# Altium schematic sheet power_module.SchDoc
size A2; CheckedBy: Ковальов С.; Author: Ковальов Ю.; SheetNumber: 2; SheetTotal: 5; ApprovedBy: _; CompanyName: ЦНТУ; Organization: Altium Limited; Address1: L3, 12a Rodborough Rd; Address2: Frenchs Forest; Address3: NSW; Address4: Australia 2086; PageSetup: Record=PageOptions|CenterHorizontal=True|CenterVertical=True|PrintScale=0.94|XCorrection=1.00|YCorrection=1.00|PrintKind=1|BorderSize=5000000|LeftOffset=0|BottomOffset=0|Orientation=1|PaperLength=1000|PaperWidth=1000|Scale=100|PaperSource=7|PrintQuality=-4|MediaType=1|DitherType=10|PaperKind=A4|PrintScaleMode=1; DecimalNumber: .001; HeadOfSector: Нач. сектора; Name: POWER MODULE; NameShort: вуп-5м; Litera: A; SCH_VERSION: Версия 0
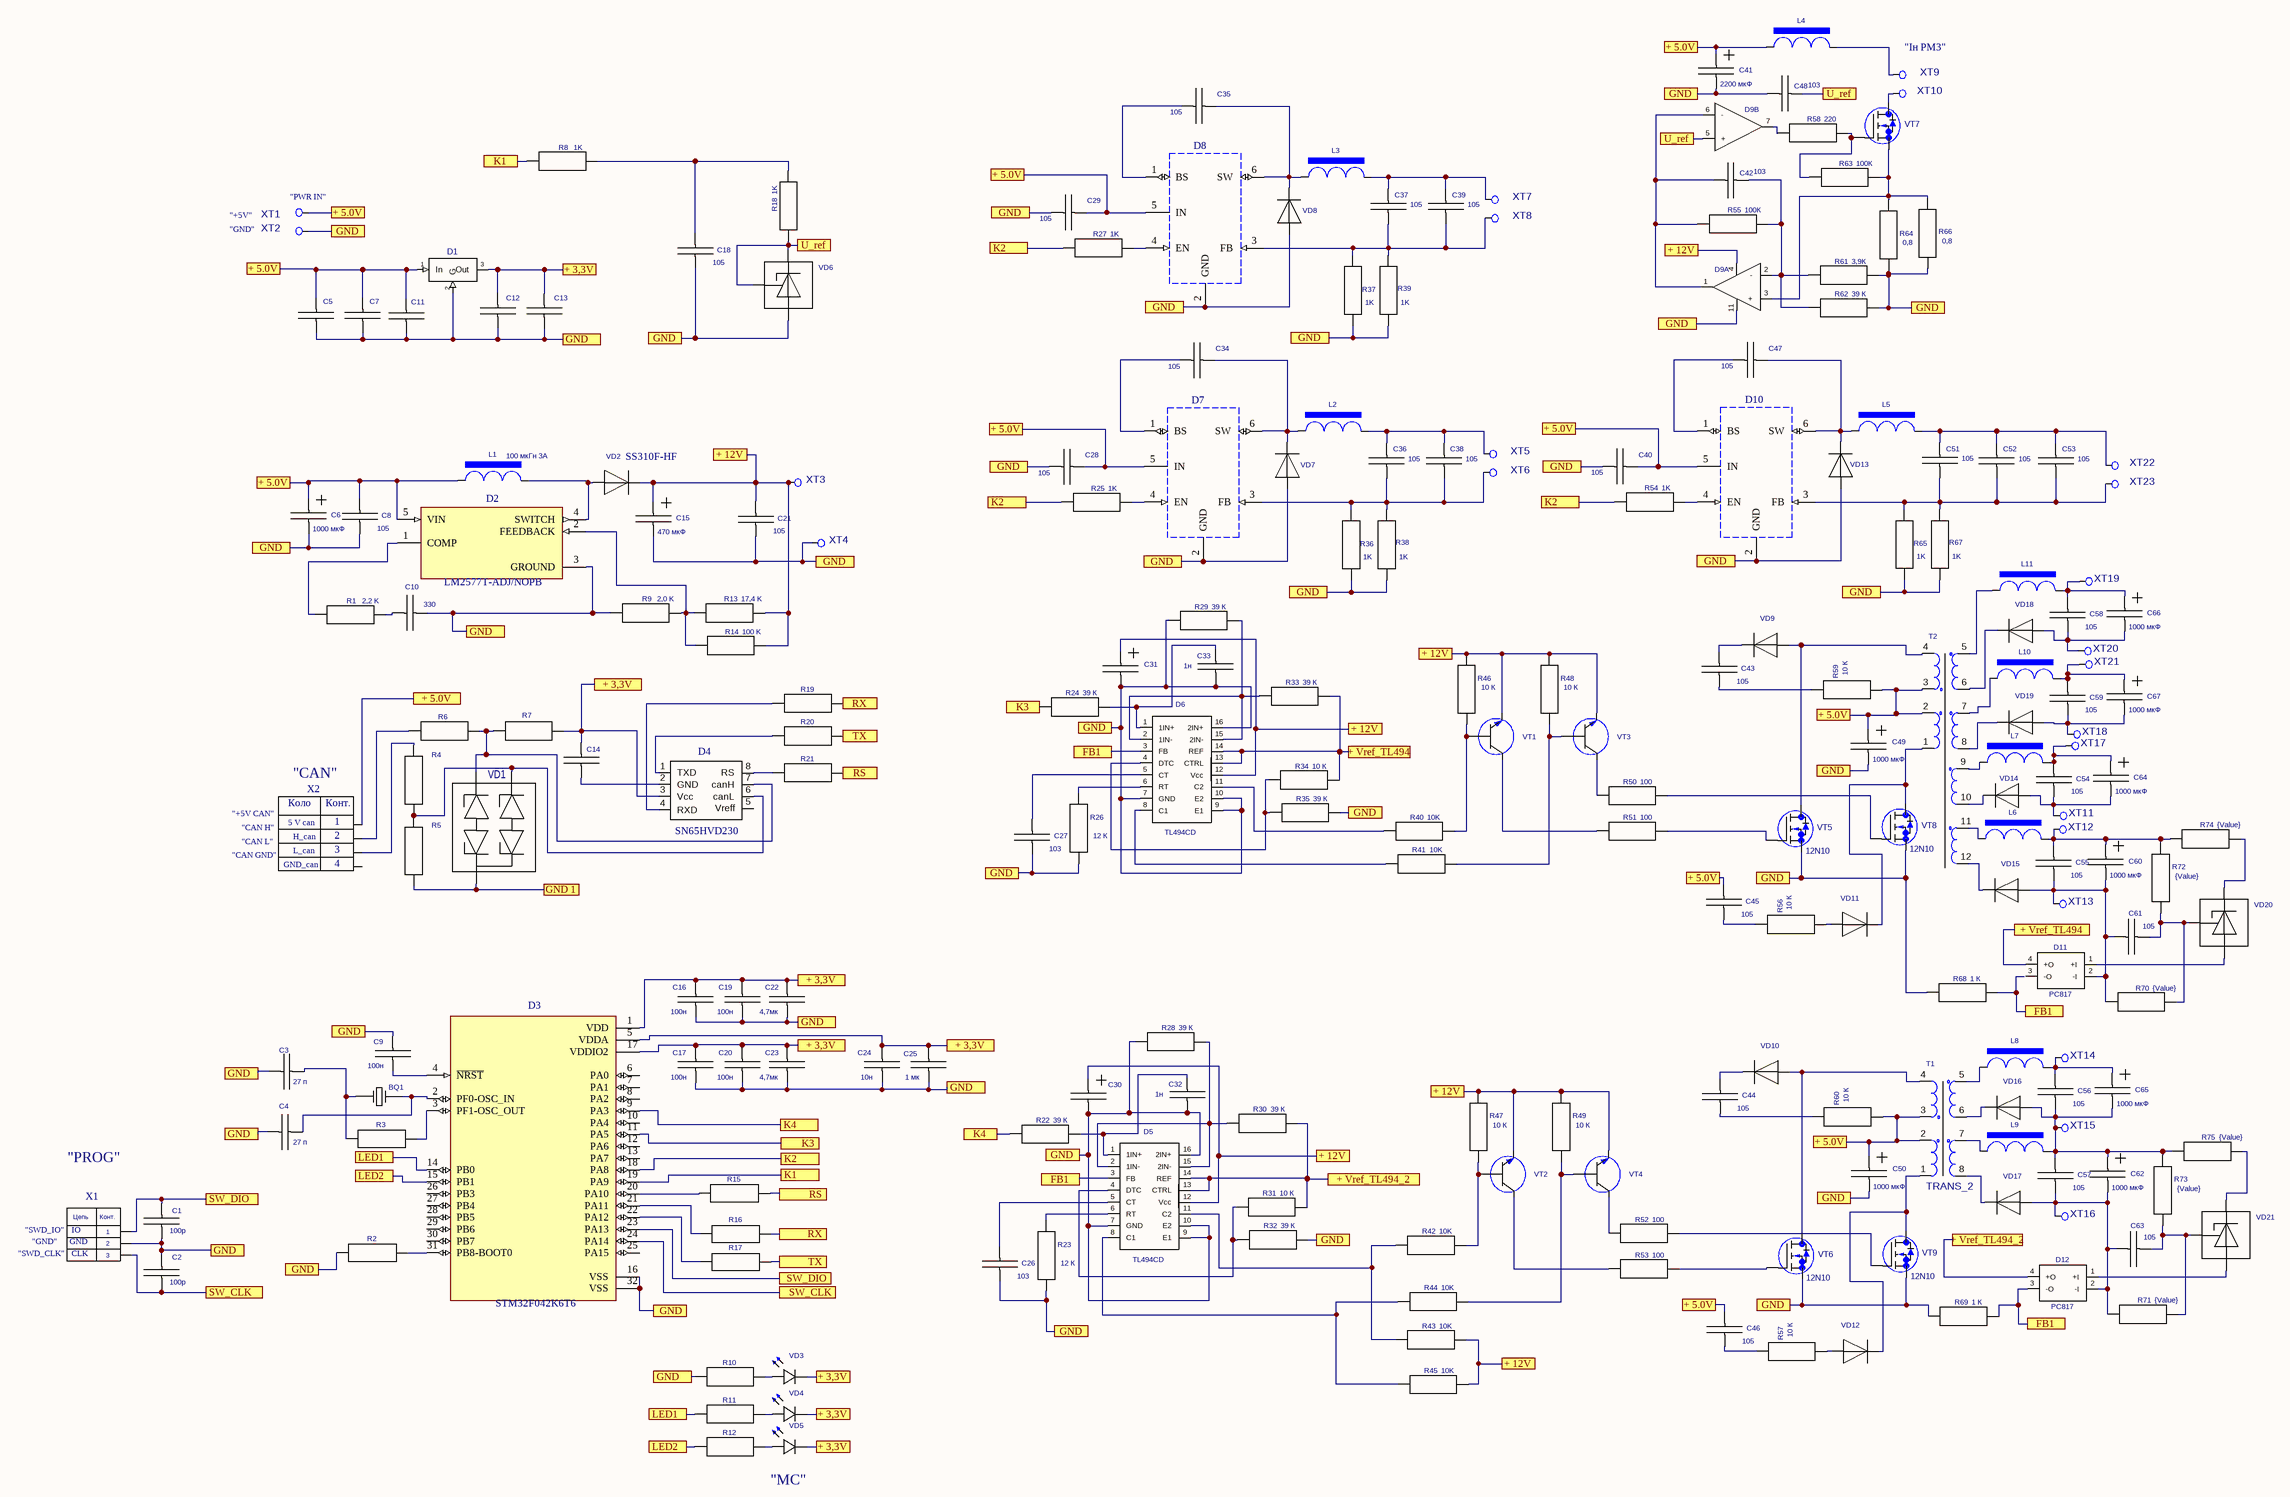
[diagram p0: power_module.SchDoc]

## Parts
BQ1  HC-49S  [HC-49S]  (value not drawn)
C1  100 p: 100p  [CAP-0805]  (hidden comment: CC0805)
C2  value 100p  [CAP-0805]  (hidden comment: CC0805)
C3  value 27 п  [CAP-0805]  (hidden comment: CC0805)
C4  value 27 п  [CAP-0805]  (hidden comment: CC0805)
C5  CAPH  [CAP-0805]  (value not drawn)
C6  value 1000 мкФ  [CAP-D8C3.5H12]  (hidden comment: C-RAD-3,5X8)
C7  CAPH  [CAP-0805]  (value not drawn)
C8  value 105  [CAP-0805]  (hidden comment: CC0805)
C9  value 100н  [CAP-0805]  (hidden comment: CC0805)
C10  value 330  [CAP-0805]  (hidden comment: CC0805)
C11  CAPH  [CAP-0805]  (value not drawn)
C12  CAPH  [CAP-0805]  (value not drawn)
C13  CAPH  [CAP-0805]  (value not drawn)
C14  CC0805  [CAP-0805]  (value not drawn)
C15  value 470 мкФ  [CAP-D8C3.5H12]  (hidden comment: C-RAD-3,5X8)
C16  value 100н  [CAP-0805]  (hidden comment: CC0805)
C17  value 100н  [CAP-0805]  (hidden comment: CC0805)
C18  value 105  [CAP-0805]  (hidden comment: CC0805)
C19  value 100н  [CAP-0805]  (hidden comment: CC0805)
C20  value 100н  [CAP-0805]  (hidden comment: CC0805)
C21  value 105  [CAP-0805]  (hidden comment: CC0805)
C22  value 4,7мк  [CAP-0805]  (hidden comment: CC0805)
C23  value 4,7мк  [CAP-0805]  (hidden comment: CC0805)
C24  value 10н  [CAP-0805]  (hidden comment: CC0805)
C25  value 1 мк  [CAP-0805]  (hidden comment: CC0805)
C26  value 103  [CAP-0805]  (hidden comment: CC0805)
C27  value 103  [CAP-0805]  (hidden comment: CC0805)
C28  value 105  [CAP-1206]  (hidden comment: CC0805)
C29  value 105  [CAP-1206]  (hidden comment: CC0805)
C30  C-RAD-3,5X8  [CAP-1206]  (value not drawn)
C31  C-RAD-3,5X8  [CAP-1206]  (value not drawn)
C32  value 1н  [CAP-0805]  (hidden comment: CC0805)
C33  value 1н  [CAP-0805]  (hidden comment: CC0805)
C34  value 105  [CAP-1206]  (hidden comment: CC0805)
C35  value 105  [CAP-1206]  (hidden comment: CC0805)
C36  value 105  [CAP-1206]  (hidden comment: CC0805)
C37  value 105  [CAP-1206]  (hidden comment: CC0805)
C38  value 105  [CAP-1206]  (hidden comment: CC0805)
C39  value 105  [CAP-1206]  (hidden comment: CC0805)
C40  value 105  [CAP-1206]  (hidden comment: CC0805)
C41  value 2200 мкФ  [CAP-D8C3.5H12]  (hidden comment: C-RAD-3,5X8)
C42  value 103  [CAP-0805]  (hidden comment: CC0805)
C43  value 105  [CAP-1206]  (hidden comment: CC0805)
C44  value 105  [CAP-1206]  (hidden comment: CC0805)
C45  value 105  [CAP-1206]  (hidden comment: CC0805)
C46  value 105  [CAP-1206]  (hidden comment: CC0805)
C47  value 105  [CAP-1206]  (hidden comment: CC0805)
C48  value 103  [CAP-0805]  (hidden comment: CC0805)
C49  value 1000 мкФ  [CAP-D8C3.5H12]  (hidden comment: C-RAD-3,5X8)
C50  value 1000 мкФ  [CAP-D8C3.5H12]  (hidden comment: C-RAD-3,5X8)
C51  value 105  [CAP-1206]  (hidden comment: CC0805)
C52  value 105  [CAP-1206]  (hidden comment: CC0805)
C53  value 105  [CAP-1206]  (hidden comment: CC0805)
C54  value 105  [CAP-0805]  (hidden comment: CC0805)
C55  value 105  [CAP-0805]  (hidden comment: CC0805)
C56  value 105  [CAP-1808(4_5x2_0mm)]  (hidden comment: CC0805)
C57  value 105  [CAP-1808(4_5x2_0mm)]  (hidden comment: CC0805)
C58  value 105  [CAP-0805]  (hidden comment: CC0805)
C59  value 105  [CAP-0805]  (hidden comment: CC0805)
C60  value 1000 мкФ  [CAP-D8C3.5H12]  (hidden comment: C-RAD-3,5X8)
C61  value 105  [CAP-0805]  (hidden comment: CC0805)
C62  value 1000 мкФ  [CAP-D10C5H20]  (hidden comment: C-RAD-3,5X8)
C63  value 105  [CAP-0805]  (hidden comment: CC0805)
C64  value 1000 мкФ  [CAP-D8C3.5H12]  (hidden comment: C-RAD-3,5X8)
C65  value 1000 мкФ  [CAP-D10C5H20]  (hidden comment: C-RAD-3,5X8)
C66  value 1000 мкФ  [CAP-D8C3.5H12]  (hidden comment: C-RAD-3,5X8)
C67  value 1000 мкФ  [CAP-D8C3.5H12]  (hidden comment: C-RAD-3,5X8)
D1  LM78M05  [DPAK(IR)]  (value not drawn)
D2  LM2577T-ADJ/NOPB  [VREG_LM2577T-ADJ/NOPB]
D3  STM32F042K6T6  [QFP80P900X900X160-32N]
D4  SN65HVD230  [8-SOIC]
D5  TL494CD  [SOIC16MY]
D6  TL494CD  [SOIC16MY]
D7  AP3211  [SOT23-6A]  (value not drawn)
D8  AP3211  [SOT23-6A]  (value not drawn)
D9  MC34074D_VCC  [14-SOIC]  (value not drawn)  (parts A,B of 4)
D10  AP3211  [SOT23-6A]  (value not drawn)
D11  PC817  [PC123PJ]
D12  PC817  [PC123PJ]
L1  value 100 мкГн 3A  [L_HCJRH01207]  (hidden comment: RLH)
L2  RLH  [L_HCJRH0704]  (value not drawn)
L3  RLH  [L_HCJRH0704]  (value not drawn)
L4  RLH  [L_HCJRH01207]  (value not drawn)
L5  RLH  [L_HCJRH0704]  (value not drawn)
L6  RLH  [L_HCJRH01207]  (value not drawn)
L7  RLH  [L_HCJRH01207]  (value not drawn)
L8  RLH  [L_HCJRH0704]  (value not drawn)
L9  RLH  [L_HCJRH0704]  (value not drawn)
L10  RLH  [L_HCJRH01207]  (value not drawn)
L11  RLH  [L_HCJRH01207]  (value not drawn)
R1  value 2,2 K  [RES-0805]  (hidden comment: RC0805)
R2  Resoistor 0805  [RES-0805]  (value not drawn)
R3  Resoistor 0805  [RES-0805]  (value not drawn)
R4  Resistor 1206  [RES-1206]  (value not drawn)
R5  Resistor 1206  [RES-1206]  (value not drawn)
R6  Resistor 1206  [RES-1206]  (value not drawn)
R7  Resistor 1206  [RES-1206]  (value not drawn)
R8  value 1K  [RES-0805]  (hidden comment: RC0805)
R9  value 2,0 K  [RES-0805]  (hidden comment: RC0805)
R10  Resoistor 0805  [RES-0805]  (value not drawn)
R11  Resoistor 0805  [RES-0805]  (value not drawn)
R12  Resoistor 0805  [RES-0805]  (value not drawn)
R13  value 17,4 K  [RES-0805]  (hidden comment: RC0805)
R14  value 100 K  [RES-0805]  (hidden comment: RC0805)
R15  Resoistor 0805  [RES-0805]  (value not drawn)
R16  Resoistor 0805  [RES-0805]  (value not drawn)
R17  Resoistor 0805  [RES-0805]  (value not drawn)
R18  value 1K  [RES-0805]  (hidden comment: RC0805)
R19  Resoistor 0805  [RES-0805]  (value not drawn)
R20  Resoistor 0805  [RES-0805]  (value not drawn)
R21  Resoistor 0805  [RES-0805]  (value not drawn)
R22  value 39 К  [RES-1206]  (hidden comment: RC0805)
R23  value 12 К  [RES-0805]  (hidden comment: RC0805)
R24  value 39 К  [RES-0805]  (hidden comment: RC0805)
R25  value 1K  [RES-0805]  (hidden comment: RC0805)
R26  value 12 К  [RES-0805]  (hidden comment: RC0805)
R27  value 1K  [RES-0805]  (hidden comment: RC0805)
R28  value 39 К  [RES-0805]  (hidden comment: RC0805)
R29  value 39 К  [RES-0805]  (hidden comment: RC0805)
R30  value 39 К  [RES-0805]  (hidden comment: RC0805)
R31  value 10 К  [RES-0805]  (hidden comment: RC0805)
R32  value 39 К  [RES-0805]  (hidden comment: RC0805)
R33  value 39 К  [RES-0805]  (hidden comment: RC0805)
R34  value 10 К  [RES-0805]  (hidden comment: RC0805)
R35  value 39 К  [RES-0805]  (hidden comment: RC0805)
R36  value 1K  [RES-2512]  (hidden comment: RC0805)
R37  value 1K  [RES-2512]  (hidden comment: RC0805)
R38  value 1K  [RES-2512]  (hidden comment: RC0805)
R39  value 1K  [RES-2512]  (hidden comment: RC0805)
R40  value 10K  [RES-0805]  (hidden comment: RC0805)
R41  value 10K  [RES-0805]  (hidden comment: RC0805)
R42  value 10K  [RES-0805]  (hidden comment: RC0805)
R43  value 10K  [RES-0805]  (hidden comment: RC0805)
R44  value 10K  [RES-0805]  (hidden comment: RC0805)
R45  value 10K  [RES-0805]  (hidden comment: RC0805)
R46  value 10 К  [RES-0805]  (hidden comment: RC0805)
R47  value 10 К  [RES-0805]  (hidden comment: RC0805)
R48  value 10 К  [RES-0805]  (hidden comment: RC0805)
R49  value 10 К  [RES-0805]  (hidden comment: RC0805)
R50  value 100  [RES-0805]  (hidden comment: RC0805)
R51  value 100  [RES-0805]  (hidden comment: RC0805)
R52  value 100  [RES-0805]  (hidden comment: RC0805)
R53  value 100  [RES-0805]  (hidden comment: RC0805)
R54  value 1K  [RES-0805]  (hidden comment: RC0805)
R55  value 100К  [RES-0805]  (hidden comment: RC0805)
R56  value 10 К  [RES-1206]  (hidden comment: RC0805)
R57  value 10 К  [RES-1206]  (hidden comment: RC0805)
R58  value 220  [RES-0805]  (hidden comment: RC0805)
R59  value 10 К  [RES-1206]  (hidden comment: RC0805)
R60  value 10 К  [RES-1206]  (hidden comment: RC0805)
R61  value 3,9К  [RES-0805]  (hidden comment: RC0805)
R62  value 39 К  [RES-0805]  (hidden comment: RC0805)
R63  value 100К  [RES-0805]  (hidden comment: RC0805)
R64  value 0,8  [RES-2512]  (hidden comment: RC0805)
R65  value 1K  [RES-2512]  (hidden comment: RC0805)
R66  value 0,8  [RES-2512]  (hidden comment: RC0805)
R67  value 1K  [RES-2512]  (hidden comment: RC0805)
R68  value 1 К  [RES-0805]  (hidden comment: RC0805)
R69  value 1 К  [RES-0805]  (hidden comment: RC0805)
R70  value {Value}  [RES-0805]  (hidden comment: RC0805)
R71  value {Value}  [RES-0805]  (hidden comment: RC0805)
R72  value {Value}  [RES-0805]  (hidden comment: RC0805)
R73  value {Value}  [RES-0805]  (hidden comment: RC0805)
R74  value {Value}  [RES-0805]  (hidden comment: RC0805)
R75  value {Value}  [RES-0805]  (hidden comment: RC0805)
T1  TRANS_2  [TRANS_R15mm_I2_II2_B]
T2  TRANS_2  [TRANS_R15mm_I2_II4 -]  (value not drawn)
VD1  Diode Surface - CDSOT23-SM712  [SOT-23A]  (value not drawn)
VD2  SS310F-HF  [SS320F]
VD3  LCW LED_ORIGINAL  [CAP-0805]  (value not drawn)
VD4  LCW LED_ORIGINAL  [CAP-0805]  (value not drawn)
VD5  LCW LED_ORIGINAL  [CAP-0805]  (value not drawn)
VD6  TL431_TO93  [TO92-LM_TL431_TO93(Primary)]  (value not drawn)
VD7  SS310F-HF  [SS320F]  (value not drawn)
VD8  SS310F-HF  [SS320F]  (value not drawn)
VD9  1N4148WS  [DIODE-SMA]  (value not drawn)
VD10  1N4148WS  [DIODE-SMA]  (value not drawn)
VD11  1N4148WS  [DIODE-SMA]  (value not drawn)
VD12  1N4148WS  [DIODE-SMA]  (value not drawn)
VD13  SS310F-HF  [SS320F]  (value not drawn)
VD14  1N4148WS  [SS320F]  (value not drawn)
VD15  1N4148WS  [SS320F]  (value not drawn)
VD16  SS310F-HF    100V 3A SMD Шоткі-діод  [DIODE-SMA]  (value not drawn)
VD17  SS310F-HF    100V 3A SMD Шоткі-діод  [DIODE-SMA]  (value not drawn)
VD18  1N4148WS  [SS320F]  (value not drawn)
VD19  1N4148WS  [SS320F]  (value not drawn)
VD20  TL431_TO93  [TO92-LM_TL431_TO93(Primary)]  (value not drawn)
VD21  TL431_TO93  [TO92-LM_TL431_TO93(Primary)]  (value not drawn)
VT1  BC847_IPC  [SOT-23_IPC]  (value not drawn)
VT2  BC847_IPC  [SOT-23_IPC]  (value not drawn)
VT3  BC847_IPC  [SOT-23_IPC]  (value not drawn)
VT4  BC847_IPC  [SOT-23_IPC]  (value not drawn)
VT5  value 12N10  [TO-220]  (hidden comment: IRF2807_VERT)
VT6  value 12N10  [TO-220]  (hidden comment: IRF2807_VERT)
VT7  IRF2807_VERT  [TO-220]  (value not drawn)
VT8  value 12N10  [TO-220]  (hidden comment: IRF2807_VERT)
VT9  value 12N10  [TO-220]  (hidden comment: IRF2807_VERT)
X1  PLS-3  [CON-PLS-3]  (value not drawn)
X2  15EDGVC-3.5-04P-14-00AH  [JUMPER4]  (value not drawn)
XT1  XT  [CON1,2]  (value not drawn)
XT2  XT  [CON1,2]  (value not drawn)
XT3  XT  [CON1,2]  (value not drawn)
XT4  XT  [CON1,2]  (value not drawn)
XT5  XT  [CON1,2]  (value not drawn)
XT6  XT  [CON1,2]  (value not drawn)
XT7  XT  [CON1,2]  (value not drawn)
XT8  XT  [CON1,2]  (value not drawn)
XT9  XT  [CON1,2]  (value not drawn)
XT10  XT  [CON1,2]  (value not drawn)
XT11  XT  [CON1,2]  (value not drawn)
XT12  XT  [CON1,2]  (value not drawn)
XT13  XT  [CON1,2]  (value not drawn)
XT14  XT  [CON1,2]  (value not drawn)
XT15  XT  [CON1,2]  (value not drawn)
XT16  XT  [CON1,2]  (value not drawn)
XT17  XT  [CON1,2]  (value not drawn)
XT18  XT  [CON1,2]  (value not drawn)
XT19  XT  [CON1,2]  (value not drawn)
XT20  XT  [CON1,2]  (value not drawn)
XT21  XT  [CON1,2]  (value not drawn)
XT22  XT  [CON1,2]  (value not drawn)
XT23  XT  [CON1,2]  (value not drawn)

## Ports
+ 3,3V, + 5.0V, + 12V, + Vref_TL494, + Vref_TL494_2, FB1, GND, GND 1, K1, K2, K3, K4, LED1, LED2, RS, RX, SW_CLK, SW_DIO, TX, U_ref

## Nets
+ 3,3V: C12.2 C13.1 C14.2 C16.2 C17.2 C19.2 C20.2 C22.2 C23.2 C24.2 C25.2 D1.3(Out) D3.1(VDD) D3.5(VDDA) D3.17(VDDIO2) D4.3(Vcc) R7.2 VD3.2 VD4.2 VD5.2 ; port + 3,3V
+ 5.0V: C5.2 C6.1 C7.2 C8.2 C11.2 C28.1 C29.1 C40.1 C41.1 C45.2 C46.2 C49.1 C50.1 D1.1(In) D2.5(VIN) D7.5(IN) D8.5(IN) D10.5(IN) L1.1 L4.1 R59.1 R60.1 T1.2 T1.3 T2.2 T2.3 X2.1 XT1.1 ; port + 5.0V
+ 12V: C15.1 C21.2 C30.1 C31.1 D5.12(Vcc) D6.12(Vcc) D9.4 R13.2 R14.2 R43.2 R45.2 R46.2 R47.2 R48.2 R49.2 VD2.2 VT1.2(E) VT2.2(E) VT3.2(E) VT4.2(E) XT3.1 ; port + 12V
+ Vref_TL494: D6.13(CTRL) D6.14(REF) D11.4(+O) R33.2 R34.2 ; port + Vref_TL494
+ Vref_TL494_2: D5.13(CTRL) D5.14(REF) D12.4(+O) R30.2 R31.2 ; port + Vref_TL494_2
FB1: D5.3(FB) D6.3(FB) D12.3(-O) R68.2 R69.2 ; port FB1
GND: C1.1 C2.2 C3.2 C4.2 C5.1 C6.2 C7.1 C8.1 C9.2 C10.1 C11.1 C12.1 C13.2 C15.2 C16.1 C17.1 C18.1 C19.1 C20.1 C21.1 C22.1 C23.1 C24.1 C25.1 C26.1 C27.1 C28.2 C29.2 C30.2 C31.2 C32.1 C33.1 C40.2 C41.2 C48.2 C49.2 C50.2 D1.2(G) D2.3(GROUND) D3.16(VSS) D3.32(VSS) D5.7(GND) D5.9(E1) D5.10(E2) D5.16(2IN+) D6.7(GND) D6.9(E1) D6.10(E2) D6.16(2IN+) D7.2(GND) D8.2(GND) D9.11 D10.2(GND) R2.2 R9.1 R10.1 R23.1 R26.1 R28.1 R29.1 R32.2 R35.2 R36.1 R37.1 R38.1 R39.1 R61.2 R62.2 R64.2 R65.1 R66.2 R67.1 R68.1 R69.1 VD6.2 VD7.1 VD8.1 VD13.1 VT5.3(S) VT6.3(S) VT8.3(S) VT9.3(S) X1.2 XT2.1 XT4.1 ; port GND
GND 1: R5.2 VD1.3 ; port GND 1
K1: D3.19(PA9) R8.1 ; port K1
K2: D3.18(PA8) R25.1 R27.1 R54.1 ; port K2
K3: D3.11(PA5) R24.1 ; port K3
K4: D3.9(PA3) R22.1 ; port K4
LED1: D3.14(PB0) R11.1 ; port LED1
LED2: D3.15(PB1) R12.1 ; port LED2
RS: R15.1 R21.2 ; port RS
RX: R16.1 R19.2 ; port RX
SW_CLK: C2.1 D3.24(PA14) X1.3 ; port SW_CLK
SW_DIO: C1.2 D3.23(PA13) X1.1 ; port SW_DIO
TX: R17.1 R20.2 ; port TX
U_ref: C48.1 D9.5(+) R18.1 VD6.1 VD6.3 ; port U_ref
NetBQ1_1: BQ1.1 C3.1 R3.2
NetBQ1_2: BQ1.2 C4.1 D3.2(PF0-OSC_IN)
NetC9_1: C9.1 D3.4(~{NRST})
NetC10_2: C10.2 R1.2
NetC14_1: C14.1 D4.2(GND)
NetC18_2: C18.2 R8.2 R18.2
NetC26_2: C26.2 D5.5(CT)
NetC27_2: C27.2 D6.5(CT)
NetC32_2: C32.2 D5.1(1IN+) R22.2
NetC33_2: C33.2 D6.1(1IN+) R24.2
NetC34_1: C34.1 D7.6(SW) L2.1 VD7.2
NetC34_2: C34.2 D7.1(BS)
NetC35_1: C35.1 D8.6(SW) L3.1 VD8.2
NetC35_2: C35.2 D8.1(BS)
NetC36_1: C36.1 C38.1 L2.2 XT5.1
NetC36_2: C36.2 C38.2 D7.3(FB) R36.2 R38.2 XT6.1
NetC37_1: C37.1 C39.1 L3.2 XT7.1
NetC37_2: C37.2 C39.2 D8.3(FB) R37.2 R39.2 XT8.1
NetC42_1: C42.1 D9.2(-) R55.2 R61.1 R62.1
NetC42_2: C42.2 D9.1 D9.6(-) R55.1
NetC43_1: C43.1 R59.2
NetC43_2: C43.2 VD9.2
NetC44_1: C44.1 R60.2
NetC44_2: C44.2 VD10.2
NetC45_1: C45.1 R56.2
NetC46_1: C46.1 R57.2
NetC47_1: C47.1 D10.6(SW) L5.1 VD13.2
NetC47_2: C47.2 D10.1(BS)
NetC51_1: C51.1 C52.1 C53.1 L5.2 XT22.1
NetC51_2: C51.2 C52.2 C53.2 D10.3(FB) R65.2 R67.2 XT23.1
NetC54_1: C54.1 C64.2 VD14.1 XT11.1
NetC54_2: C54.2 C64.1 L7.2 XT17.1
NetC55_1: C55.1 C60.2 C61.2 D11.2(-I) R70.2 VD15.1 XT13.1
NetC55_2: C55.2 C60.1 L6.2 R72.1 R74.2 XT12.1
NetC56_1: C56.1 C57.2 C62.1 C65.2 L9.2 R73.1 R75.2 VD16.1 XT15.1
NetC56_2: C56.2 C65.1 L8.2 XT14.1
NetC57_1: C57.1 C62.2 C63.2 D12.2(-I) R71.2 VD17.1 XT16.1
NetC58_1: C58.1 C66.2 VD18.1 XT20.1
NetC58_2: C58.2 C66.1 L11.2 XT19.1
NetC59_1: C59.1 C67.2 VD19.1 XT18.1
NetC59_2: C59.2 C67.1 L10.2 XT21.1
NetC61_1: C61.1 R70.1 R72.2 VD20.1
NetC63_1: C63.1 R71.1 R73.2 VD21.1
NetD2_1: D2.1(COMP) R1.1
NetD2_2: D2.2(FEEDBACK) R9.2 R13.1 R14.1
NetD2_4: D2.4(SWITCH) L1.2 VD2.1
NetD3_3: D3.3(PF1-OSC_OUT) R3.1
NetD3_20: D3.20(PA10) R15.2
NetD3_21: D3.21(PA11) R16.2
NetD3_22: D3.22(PA12) R17.2
NetD3_31: D3.31(PB8-BOOT0) R2.1
NetD4_1: D4.1(TXD) R20.1
NetD4_4: D4.4(RXD) R19.1
NetD4_6: D4.6(canL) R4.2 R5.1 VD1.1
NetD4_7: D4.7(canH) R6.1 R7.1 VD1.2
NetD4_8: D4.8(RS) R21.1
NetD5_2: D5.2(1IN-) D5.15(2IN-) R28.2 R30.1
NetD5_4: D5.4(DTC) R31.1 R32.1
NetD5_6: D5.6(RT) R23.2
NetD5_8: D5.8(C1) R44.1 R45.1
NetD5_11: D5.11(C2) R42.1 R43.1
NetD6_2: D6.2(1IN-) D6.15(2IN-) R29.2 R33.1
NetD6_4: D6.4(DTC) R34.1 R35.1
NetD6_6: D6.6(RT) R26.2
NetD6_8: D6.8(C1) R41.1
NetD6_11: D6.11(C2) R40.1
NetD7_4: D7.4(EN) R25.2
NetD8_4: D8.4(EN) R27.2
NetD9_3: D9.3(+) R63.2 R64.1 R66.1 VT7.3(S)
NetD9_7: D9.7 R58.1
NetD10_4: D10.4(EN) R54.2
NetD11_1: D11.1(+I) VD20.2
NetD12_1: D12.1(+I) VD21.2
NetL4_2: L4.2 XT9.1
NetL6_1: L6.1 T2.11
NetL7_1: L7.1 T2.9
NetL8_1: L8.1 T1.5
NetL9_1: L9.1 T1.7
NetL10_1: L10.1 T2.7
NetL11_1: L11.1 T2.5
NetR4_1: R4.1 X2.3
NetR6_2: R6.2 X2.2
NetR10_2: R10.2 VD3.1
NetR11_2: R11.2 VD4.1
NetR12_2: R12.2 VD5.1
NetR40_2: R40.2 R46.1 VT1.1(B)
NetR41_2: R41.2 R48.1 VT3.1(B)
NetR42_2: R42.2 R47.1 VT2.1(B)
NetR44_2: R44.2 R49.1 VT4.1(B)
NetR50_1: R50.1 VT3.3(C)
NetR50_2: R50.2 VT8.1(G)
NetR51_1: R51.1 VT1.3(C)
NetR51_2: R51.2 VT5.1(G)
NetR52_1: R52.1 VT4.3(C)
NetR52_2: R52.2 VT9.1(G)
NetR53_1: R53.1 VT2.3(C)
NetR53_2: R53.2 VT6.1(G)
NetR56_1: R56.1 VD11.1
NetR57_1: R57.1 VD12.1
NetR58_2: R58.2 R63.1 VT7.1(G)
NetR74_1: R74.1 VD20.3
NetR75_1: R75.1 VD21.3
NetT1_1: T1.1 VD12.2 VT9.2(D)
NetT1_4: T1.4 VD10.1 VT6.2(D)
NetT1_6: T1.6 VD16.2
NetT1_8: T1.8 VD17.2
NetT2_1: T2.1 VD11.2 VT8.2(D)
NetT2_4: T2.4 VD9.1 VT5.2(D)
NetT2_6: T2.6 VD18.2
NetT2_8: T2.8 VD19.2
NetT2_10: T2.10 VD14.2
NetT2_12: T2.12 VD15.2
NetVT7_2: VT7.2(D) XT10.1

Not connected (* = marked no-connect by the designer): D3 6(PA0) 7(PA1) 8(PA2) 10(PA4) 12(PA6) 13(PA7) 25(PA15) 26(PB3) 27(PB4) 28(PB5) 29(PB6) 30(PB7); D4 5(Vreff); D11 3(-O); VD3 3(GND); VD4 3(GND); VD5 3(GND); X2 4

## Notes on the sheet
- (near XT9) "Iн PM3"
- (near XT1) "PWR IN"
- "+5V"
- "GND"
- "CAN"
- "+5V CAN"
- "CAN H"
- "CAN L"
- (near X2) 5 V can
- (near X2) H_can
- (near X2) L_can
- "CAN GND"
- (near X2) GND_can
- "PROG"
- "SWD_CLK"
- "SWD_IO"
- (near X1) GND
- (near X1) CLK
- (near X1) IO
- "MC"
- Title
- Size:
- Date:
- File:
- A2
- Number:
- Time:
- Revision:
- Sheet
- of
- (in symbol 15EDGVC-3.5-04P-14-00AH) Коло; Конт.
- (in symbol PLS-3) Цепь; Конт.

## Library data of the parts
BQ1 = HC-49S: Value: {Value}
C5 C7 C11-C13 = CAPH: Value: 1 мк
C14 = CC0805: GRM21BR71H104KA01; Value: GRM21BR71H104KA01
C30 C31 = C-RAD-3,5X8: Value: 1000 мкФ
D1 = LM78M05: 5 Volt 3-Terminal Positive REGULATOR; Value: LM3,3V
D2 = LM2577T-ADJ/NOPB: 3.5-V to 40-V, 3-A low component count step-up regulator / 𝑉𝑜𝑢𝑡=1.23⋅(1+𝑅2/𝑅1); MF: Texas Instruments; SnapEDA_Link: https://www.snapeda.com/parts/LM2577T-ADJ/NOPB/Texas+Instruments/view-part/?ref=snap; Package: TO-220-5 Texas Instruments; Value: *; MP: LM2577T-ADJ/NOPB; Check_prices: https://www.snapeda.com/parts/LM2577T-ADJ/NOPB/Texas+Instruments/view-part/?ref=eda
D3 = STM32F042K6T6: ARMÂ® CortexÂ®-M0 STM32F0 Microcontroller IC 32-Bit Single-Core 48MHz 32KB (32K x 8) FLASH 32-LQFP (7x7); MF: STMicroelectronics; Price: None; Availability: In Stock; MP: STM32F042K6T6; Package: LQFP-32 STMicroelectronics; SnapEDA_Link: https://www.snapeda.com/parts/STM32F042K6T6/STMicroelectronics/view-part/?ref=snap; Check_prices: https://www.snapeda.com/parts/STM32F042K6T6/STMicroelectronics/view-part/?ref=eda; Value: *; Purchase-URL: https://pricing.snapeda.com/search/part/STM32F042K6T6/?ref=eda
D5 D6 = TL494CD: Value: TL494D
D7 D8 D10 = AP3211: Conv DC-DC 4.5V to 18V Synchronous Step Down Single-Out 0.81V to 15V 1.5A 6-Pin SOT-26 T/R; MF: Diodes Zetex; SnapEDA_Link: https://www.snapeda.com/parts/AP3211/Diodes+Inc./view-part/?ref=snap; Package: None; Value: *; MP: AP3211; Check_prices: https://www.snapeda.com/parts/AP3211/Diodes+Inc./view-part/?ref=eda
D9 = MC34074D_VCC: Value: LMV324
L2 L3 L5 = RLH: Value: HCJRH0704-470MT (47 мкГн 0,88A 7mm x 7mm)
L4 = RLH: Value: HCJRH1207 - 100MT (10 мкГн 5,4A 12mm x 12mm); URL: http://mail.kosmodrom.com.ua/prodlist.php?name=drosselcdrh104r
L6-L11 = RLH: Value: HCJRH1207 - 470MT 47 мкГн 2,5A 12mm x 12mm; URL: http://mail.kosmodrom.com.ua/prodlist.php?name=drosselcdrh104r
R2 R3 R10-R12 R15-R17 = R0805MY: Resistor 0805, 10 kOhm, 5% 0805S8J0103T5E; Value: 0805S8J0103T5E
R4 R5 R7 = R1206_IPC: Resistor 1206, 20 Ohm, 5%, 1206W4J0200T5E; Value: 1206W4J0200T5E; ComponentLink1Description: datasheet; ComponentLink1URL: https://eu.mouser.com/datasheet/2/1365/1-3044649.pdf
R6 = R0805MY: Resistor 1206, 20 Ohm, 5%, 1206W4J0200T5E; Value: 1206W4J0200T5E
R19-R21 = R0805MY: Resistor 0805, 10 kOhm, 5% 0805S8J0103T5E; Value: 0805S8J0101T5E
T2 = TRANS_2_4: Value: *
VD1 = CDSOT23-SM712: Diode Surface - CDSOT23-SM712, / 26V, 14V Clamp 17A (8/20µs) Ipp Tvs, SOT-23-3; Value: CDSOT23-SM712; ComponentLink1Description: on digikey; ComponentLink1URL: https://www.digikey.si/en/products/detail/bourns-inc/CDSOT23-SM712/1630592?s=N4IgTCBcDaIMIBEDKB5AKmAzAWiQWQHYBGCAXQF8g
VD2 VD7 VD8 VD13 = 1N4148WS: SS310F-HF    100V 3A SMD Шоткі-діод; Value: SS310F-HF
VD6 VD20 VD21 = TL431_TO93: Value: TL431
VD16 VD17 = 1N4148WS: Value: SS310F-HF    100V 3A SMD Шоткі-діод
VT1-VT4 = BC847_IPC: Value: BC857
VT5 VT6 VT8 VT9 = IRF2807_VERT: N-Channel Enhancement-Mode MOSFET (TMOS)
VT7 = IRF2807_VERT: N-Channel Enhancement-Mode MOSFET (TMOS); Value: IR530
D4 = SN65HVD230: value: SN65HVD230
D11 D12 = PC817: Value: *
T1 = TRANS_2: Value: *
VD3-VD5 = LCW LED_ORIGINAL: Value: *
VD9-VD12 VD14 VD15 VD18 VD19 = 1N4148WS: Value: *
XT1-XT23 = XT: Value: *